# Altium schematic sheet Buttons-Sheet.SchDoc
size A4; SheetNumber: 6; SheetTotal: 8
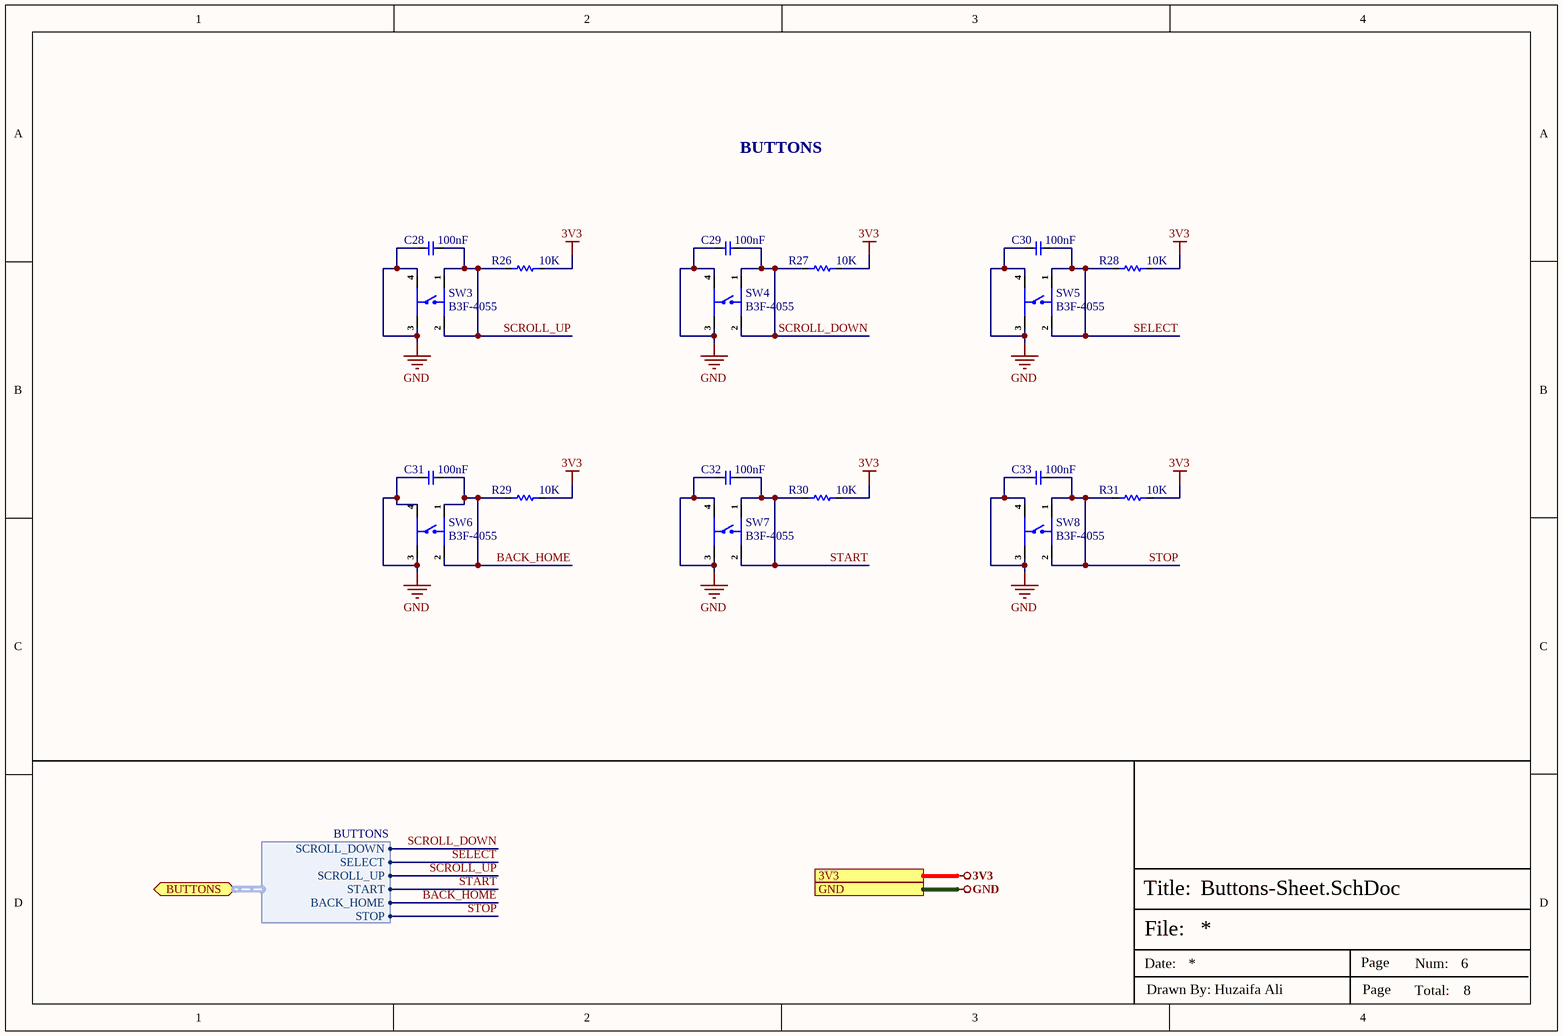
[diagram p0: Buttons-Sheet.SchDoc]

## Parts
C28  100nF  [Cap-0603]
C29  100nF  [Cap-0603]
C30  100nF  [Cap-0603]
C31  100nF  [Cap-0603]
C32  100nF  [Cap-0603]
C33  100nF  [Cap-0603]
R26  10K  [Res-0603]
R27  10K  [Res-0603]
R28  10K  [Res-0603]
R29  10K  [Res-0603]
R30  10K  [Res-0603]
R31  10K  [Res-0603]
SW3  B3F-4055  [B3F-4055]
SW4  B3F-4055  [B3F-4055]
SW5  B3F-4055  [B3F-4055]
SW6  B3F-4055  [B3F-4055]
SW7  B3F-4055  [B3F-4055]
SW8  B3F-4055  [B3F-4055]

## Ports
3V3 (see Top-Sheet[3A], ADC-Sheet[3D], Controller-Sheet[3D], IO-Expander-Sheet[3D], Power-Sheet[3D], Sensor-Comms-Sheet[3D]), BUTTONS (bidir, harness BUTTONS, see Top-Sheet[4A], IO-Expander-Sheet[1D]), GND (see Top-Sheet[3A], ADC-Sheet[3D], Controller-Sheet[3D], IO-Expander-Sheet[3D], Power-Sheet[3D], Relay-Sheet[3D], Sensor-Comms-Sheet[3D])

## Harnesses
BUTTONS: SELECT, SCROLL_DOWN, SCROLL_UP, START, BACK_HOME, STOP

## Nets
3V3: R26.1 R27.1 R28.1 R29.1 R30.1 R31.1 ; port 3V3
GND: C28.2 C29.2 C30.2 C31.2 C32.2 C33.2 SW3.3 SW3.4 SW4.3 SW4.4 SW5.3 SW5.4 SW6.3 SW6.4 SW7.3 SW7.4 SW8.3 SW8.4 ; port GND
BACK_HOME: C31.1 R29.2 SW6.1 SW6.2 ; port BUTTONS.BACK_HOME
SCROLL_DOWN: C29.1 R27.2 SW4.1 SW4.2 ; port BUTTONS.SCROLL_DOWN
SCROLL_UP: C28.1 R26.2 SW3.1 SW3.2 ; port BUTTONS.SCROLL_UP
SELECT: C30.1 R28.2 SW5.1 SW5.2 ; port BUTTONS.SELECT
START: C32.1 R30.2 SW7.1 SW7.2 ; port BUTTONS.START
STOP: C33.1 R31.2 SW8.1 SW8.2 ; port BUTTONS.STOP

## Notes on the sheet
- BUTTONS
- File:
- Title:
- Date:
- Page
- Num:
- Total:
- Drawn By: Huzaifa Ali

## Library data of the parts
C28-C33 = CC0603KRX5R9BB104: CAP CER 0.1UF 50V X5R 0603; Manufacturer: Yageo; Tolerance: 10%; Item Type: Capacitor; Supplier 1: Digi-Key; Manufacturer Part Number: CC0603KRX5R9BB104; RoHS: Yes; Category: Ceramic Capacitors; Stock 1: 152253; Pricing 1: 1=0.10000, 10=0.05200, 50=0.02820, 100=0.02310, 500=0.01648, 1000=0.01294 (USD); Mount: Surface Mount; Case/Package: 0603; Case Code (Imperial): 0603; Case Code (Metric): 1608; Weight: 7.1E-05oz; Min Operating Temperature: -55°C; Max Operating Temperature: 85°C; Capacitance: 100nF; Packaging: Tape and Reel; Voltage Rating: 50V; Dielectric: X5R; Termination: SMD/SMT; Voltage Rating (DC): 50V; Package Quantity: 4000; Length: 0.063inch; Width: 0.031inch; Thickness: 0.035inch; Lead Free: Lead Free; Halogen Free: Halogen Free; ComponentLink1URL: http://www.mouser.com/ds/2/447/Yageo_UPY-GP_NP0_16V-to-50V_9-358835.pdf?src-supplier=Mouser; ComponentLink1Description: http://www.mouser.com/ds/2/447/Yageo_UPY-GP_NP0_16V-to-50V_9-358835.pdf?src-supplier=Mouser; ComponentLink2URL: https://www.yageo.com/upload/media/product/productsearch/datasheet/mlcc/UPY-GPHC_X5R_4V-to-50V_26.pdf?src-supplier=Digi-Key; ComponentLink2Description: https://www.yageo.com/upload/media/product/productsearch/datasheet/mlcc/UPY-GPHC_X5R_4V-to-50V_26.pdf?src-supplier=Digi-Key; ComponentLink3URL: http://www.yageo.com/exep/pages/download/literatures/ProductSelectionGuide%202014_Final_2.pdf?src-supplier=Digi-Key; ComponentLink3Description: http://www.yageo.com/exep/pages/download/literatures/ProductSelectionGuide%202014_Final_2.pdf?src-supplier=Digi-Key; Supplier Part Number 1: 311-4046-1-ND; LCSC Part Number: C110022
R26-R31 = RC0603FR-0710KL: RES SMD 10K Ohm 1% 1/10W 0603; Manufacturer: Yageo; Resistance: 10kR; Temperature Coefficient: 100ppm/°C; Voltage Rating (DC): 50V; Power Rating: 100mW; Voltage Rating: 75V; Item Type: Resistor; Supplier 1: Digi-Key; Manufacturer Part Number: RC0603FR-0710KL; RoHS: Yes; Category: Chip SMD Resistors; Stock 1: 25249139; Pricing 1: 1=0.10000, 10=0.02400, 100=0.00970, 1000=0.00436, 2500=0.00378 (USD); Case/Package: 0603; Number of Pins: 2; Case Code (Imperial): 0603; Case Code (Metric): 1608; Weight: 7.1E-05oz; Size Code: 0603; Min Operating Temperature: -55°C; Max Operating Temperature: 155°C; Tolerance: 1%; Resistor Type: Thick Film; Packaging: Tape and Reel; Termination: SMD/SMT; Features: Moisture Resistant; Series: RC; Max Power Dissipation: 100mW; Number of Terminations: 2; Resistance Tolerance: 1%; Construction: Rectangular; Length: 1.6mm; Width: 0.8mm; Height: 0.45mm; Depth: 0.8mm; Lead Pitch: 0.3mm; REACH SVHC: Unknown; Lead Free: Lead Free; Military Standard: Not; RoHS Compliant: Yes; ComponentLink1URL: https://datasheet.ciiva.com/7660/38590-7660789.pdf?src-supplier=Element14; ComponentLink1Description: https://datasheet.ciiva.com/7660/38590-7660789.pdf?src-supplier=Element14; ComponentLink2URL: https://datasheet.ciiva.com/7983/443971-7983596.pdf?src-supplier=Element14; ComponentLink2Description: https://datasheet.ciiva.com/7983/443971-7983596.pdf?src-supplier=Element14; ComponentLink3URL: https://datasheet.ciiva.com/22747/443971-22747519.pdf?src-supplier=Element14; ComponentLink3Description: https://datasheet.ciiva.com/22747/443971-22747519.pdf?src-supplier=Element14; ComponentLink4URL: https://datasheet.ciiva.com/46440/1868787-46440891.pdf?src-supplier=Element14; ComponentLink4Description: https://datasheet.ciiva.com/46440/1868787-46440891.pdf?src-supplier=Element14; ComponentLink5URL: https://datasheet.ciiva.com/7746/1738695-7746239.pdf?src-supplier=Element14; ComponentLink5Description: https://datasheet.ciiva.com/7746/1738695-7746239.pdf?src-supplier=Element14; ComponentLink6URL: https://datasheet.ciiva.com/15189/getdatasheetpartid-409289-15189591.pdf?src-supplier=Verical; ComponentLink6Description: https://datasheet.ciiva.com/15189/getdatasheetpartid-409289-15189591.pdf?src-supplier=Verical; Supplier Part Number 1: 311-10.0KHRCT-ND; LCSC Part Number: C98220
SW3-SW8 = B3F-4055: SWITCH TACTILE SPST-NO 0.05A 24V; Manufacturer: Omron; Item Type: Tactile Switche; Number of Positions: 2NUMBER; Supplier: Avnet; Supplier Part Number: 36K1872; Manufacturer Part Number: B3F-4055; RoHS: Yes; Stock: 55; Pricing: 1=0.617, 10=0.574, 25=0.55, 50=0.525, 100=0.501 (USD); Color: 54Colour; Lead Free: 5697LeadFree; ComponentLink1URL: https://datasheet.ciiva.com/27056/2086688-27056647.pdf?src-supplier=Jameco; ComponentLink1Description: https://datasheet.ciiva.com/27056/2086688-27056647.pdf?src-supplier=Jameco; ComponentLink2URL: https://datasheet.ciiva.com/5283/b3f-0811-26083-5283663.pdf?src-supplier=Mouser; ComponentLink2Description: https://datasheet.ciiva.com/5283/b3f-0811-26083-5283663.pdf?src-supplier=Mouser; ComponentLink3URL: https://datasheet.ciiva.com/1532/611570-1532596.pdf?src-supplier=Element14; ComponentLink3Description: https://datasheet.ciiva.com/1532/611570-1532596.pdf?src-supplier=Element14; ComponentLink4URL: https://datasheet.ciiva.com/16154/en-b3f-16154911.pdf?src-supplier=Onlinecomponents.com; ComponentLink4Description: https://datasheet.ciiva.com/16154/en-b3f-16154911.pdf?src-supplier=Onlinecomponents.com; ComponentLink5URL: https://datasheet.ciiva.com/2900/b3f-0811-2900013.pdf?src-supplier=Digikey; ComponentLink5Description: https://datasheet.ciiva.com/2900/b3f-0811-2900013.pdf?src-supplier=Digikey; ComponentLink6URL: https://datasheet.ciiva.com/30212/en-b3f-30212214.pdf?src-supplier=Onlinecomponents.com; ComponentLink6Description: https://datasheet.ciiva.com/30212/en-b3f-30212214.pdf?src-supplier=Onlinecomponents.com; LCSC Part Number: C84931